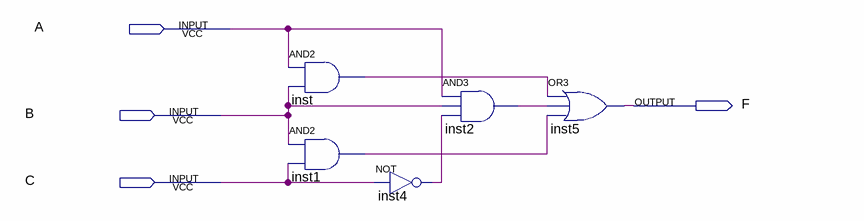
[diagram p0: schematic sheet]
// Quartus schematic Ex2.bdf as structural Verilog: 5 symbols, 4 pins
module Ex2 (
  input  A,
  input  B,
  input  C,
  output F
);

  wire inst1_out, inst2_out, inst4_out, inst_out;

  and inst (inst_out, A, B);
  and inst1 (inst1_out, B, C);
  and inst2 (inst2_out, A, B, inst4_out);
  not inst4 (inst4_out, C);
  or inst5 (F, inst_out, inst2_out, inst1_out);
endmodule
